# Altium schematic sheet charge_block.SchDoc
size A4 portrait; DrawnBy: Ochkaritus; SheetNumber: 3; SheetTotal: 3
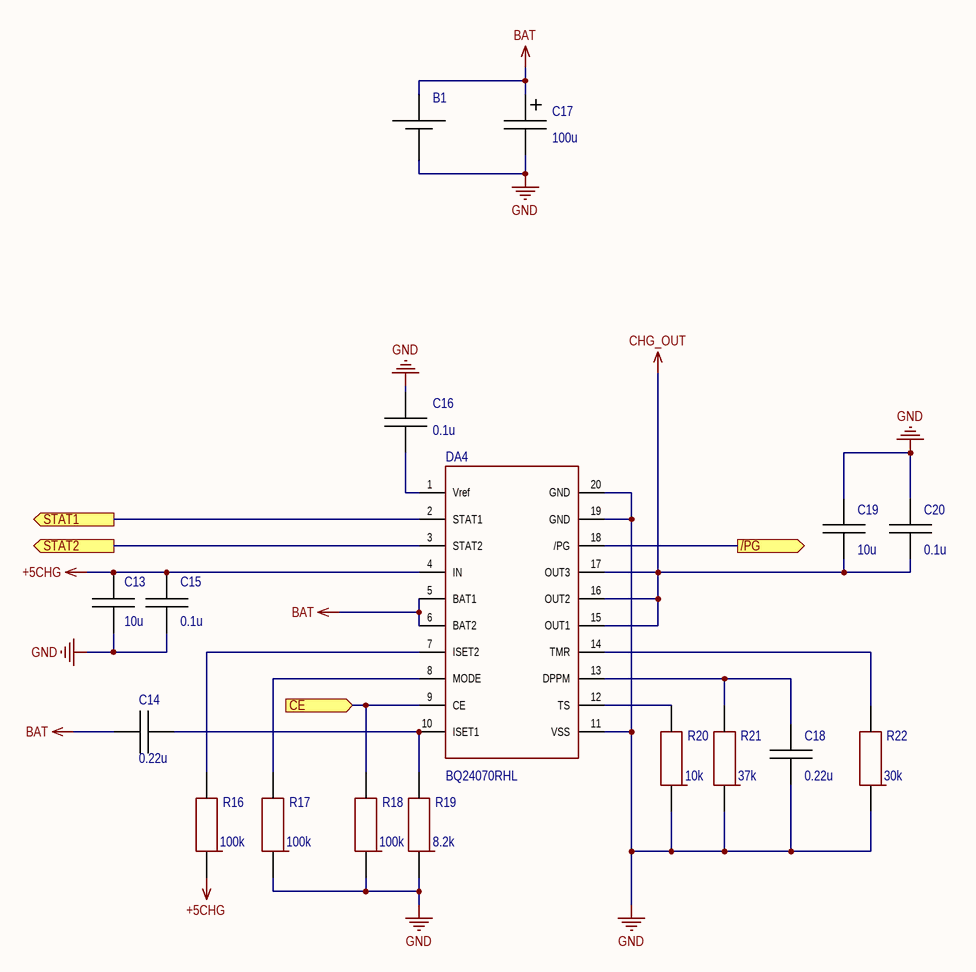
[diagram p0: charge_block.SchDoc]

## Parts
B1  BAT  [bat_cont]  (value not drawn)
C13  10u  [C0402]
C14  0.22u  [C0402]
C15  0.1u  [C0402]
C16  0.1u  [C0402]
C17  100u  [CAP TA 3216]
C18  0.22u  [C0402]
C19  10u  [C0402]
C20  0.1u  [C0402]
DA4  BQ24070RHL  [VQFN20 (3.5*4.5)]
R16  100k  [0402]
R17  100k  [0402]
R18  100k  [0402]
R19  8.2k  [0402]
R20  10k  [0402]
R21  37k  [0402]
R22  30k  [0402]

## Ports
/PG (out, see Control block[3B]), CE (in, see Control block[4B]), STAT1 (out, see Control block[4B]), STAT2 (out, see Control block[4B])

## Nets
+5CHG: C13.1 C15.1 DA4.4(IN) R16.1
BAT: B1.1(P) C14.1 C17.1 DA4.5(BAT1) DA4.6(BAT2)
CHG_OUT: C19.1 C20.1 DA4.15(OUT1) DA4.16(OUT2) DA4.17(OUT3)
GND: B1.2(N) C13.2 C15.2 C16.2 C17.2 C18.1 C19.2 C20.2 DA4.11(VSS) DA4.19(GND) DA4.20(GND) R17.1 R18.1 R19.1 R20.1 R21.1 R22.1
/PG: DA4.18(/PG) ; port /PG
CE: DA4.9(CE) R18.2 ; port CE
STAT1: DA4.2(STAT1) ; port STAT1
STAT2: DA4.3(STAT2) ; port STAT2
NetC14_2: C14.2 DA4.10(ISET1) R19.2
NetC16_1: C16.1 DA4.1(Vref)
NetC18_2: C18.2 DA4.13(DPPM) R21.2
NetDA4_7: DA4.7(ISET2) R16.2
NetDA4_8: DA4.8(MODE) R17.2
NetDA4_12: DA4.12(TS) R20.2
NetDA4_14: DA4.14(TMR) R22.2

## Library data of the parts
C13-C16 C18-C20 = Capacitor
C17 = Capacitor Pol
R16-R22 = Resistor